# EAGLE schematic Cricket Game Schematic (EAGLE 9.6.2)
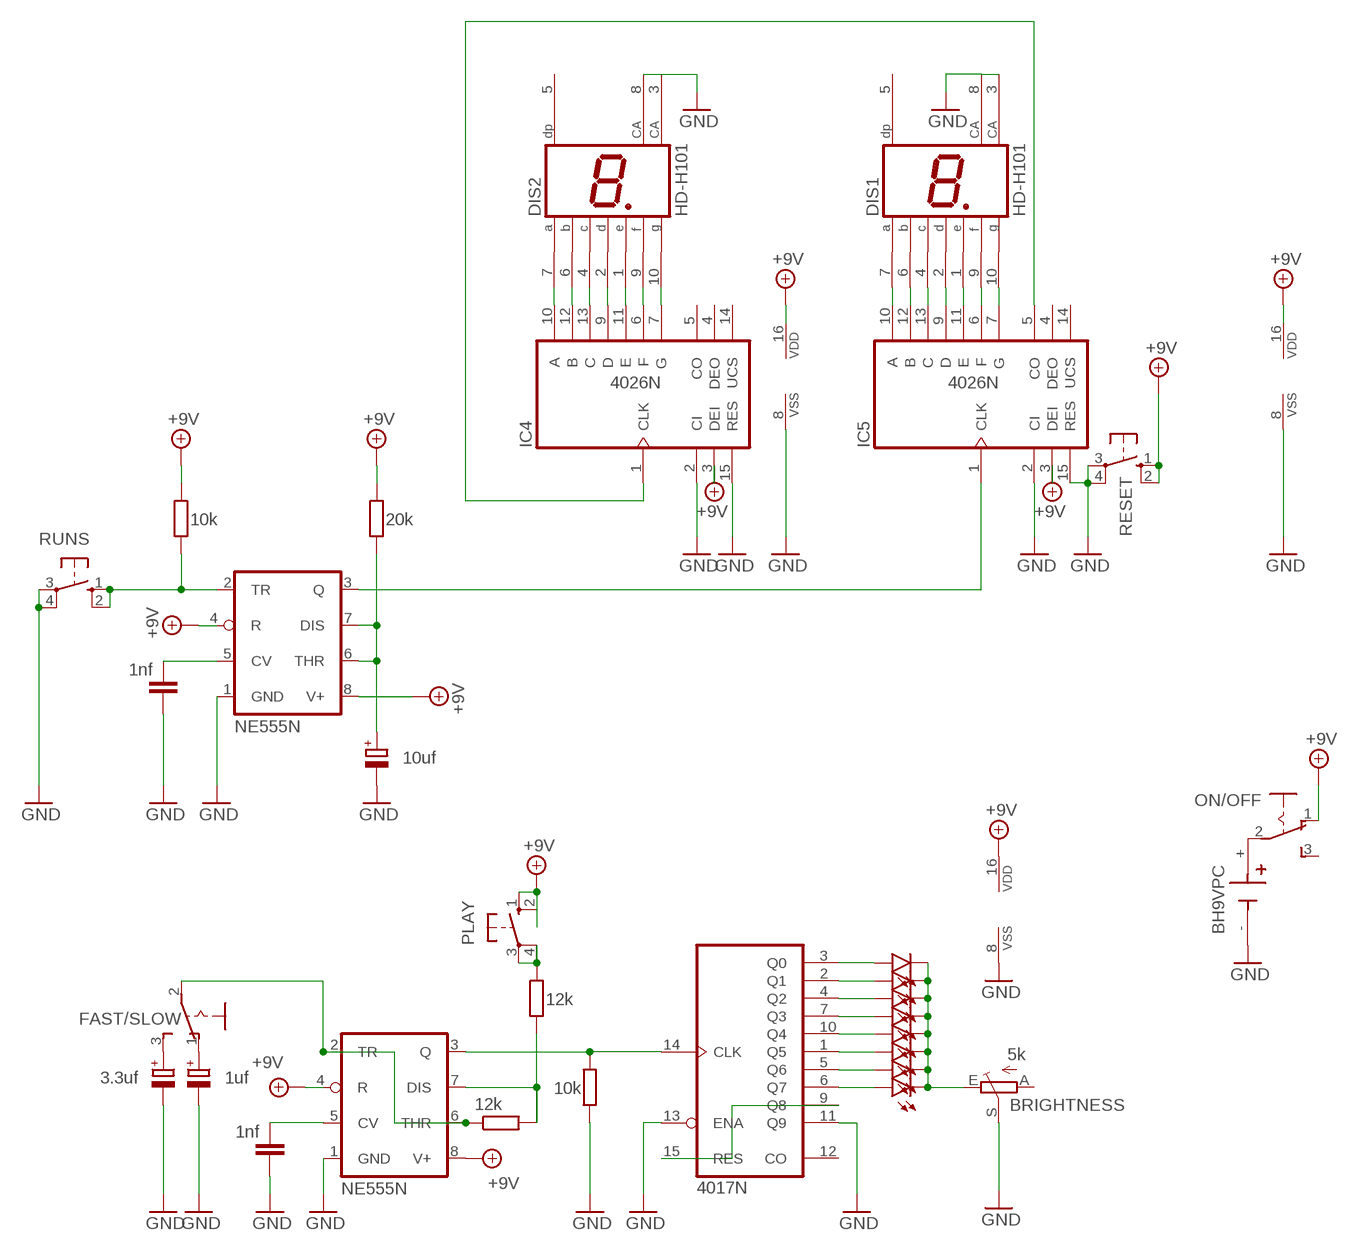
[diagram p0: schematic, sheet 1]

## Parts
BRIGHTNESS  5k  TRIM_EU-B25P  [B25P]
BT1  BH9VPC  [BAT_BH9VPC]
C1  1uf  CPOL-EUE2,5-6E  [E2,5-6E]
C2  3.3uf  CPOL-EUE2,5-6E  [E2,5-6E]
C3  1nf  C-EU050-024X044  [C050-024X044]
C4  1nf  C-EU050-024X044  [C050-024X044]
C5  10uf  CPOL-EUE2,5-6E  [E2,5-6E]
DIS1  HD-H101  [HDSP-M]
DIS2  HD-H101  [HDSP-M]
FAST/SLOW  M251  [M251]
IC1  NE555N  [DIL08]
IC2  4017N  [DIL16]
IC3  NE555N  [DIL08]
IC4  4026N  [DIL16]
IC5  4026N  [DIL16]
LED1  LED3MM  [LED3MM]
LED2  LED3MM  [LED3MM]
LED3  LED3MM  [LED3MM]
LED4  LED3MM  [LED3MM]
LED5  LED3MM  [LED3MM]
LED6  LED3MM  [LED3MM]
LED7  LED3MM  [LED3MM]
LED8  LED3MM  [LED3MM]
ON/OFF  M251  [M251]
PLAY  10-XX  [B3F-10XX]
R1  12k  R-EU_0207/10  [0207/10]
R2  12k  R-EU_0207/10  [0207/10]
R3  20k  R-EU_0207/10  [0207/10]
R4  10k  R-EU_0207/10  [0207/10]
R5  10k  R-EU_0207/10  [0207/10]
RESET  10-XX  [B3F-10XX]
RUNS  10-XX  [B3F-10XX]

## Nets
+9V: IC1.4(R) IC1.8(V+) IC2.16(VDD) IC3.4(R) IC3.8(V+) IC4.3(DEI) IC4.16(VDD) IC5.3(DEI) IC5.16(VDD) ON/OFF.1(O) PLAY.1(S) PLAY.2(S1) R3.1 R5.1 RESET.1(S) RESET.2(S1)
GND: BRIGHTNESS.S BT1.- C1.- C2.- C3.1 C4.1 C5.- DIS1.3(CA) DIS1.8(CA) DIS2.3(CA) DIS2.8(CA) IC1.1(GND) IC2.8(VSS) IC2.11(Q9) IC2.13(ENA) IC3.1(GND) IC4.2(CI) IC4.8(VSS) IC4.15(RES) IC5.2(CI) IC5.8(VSS) IC5.15(RES) R4.1 RESET.3(P) RESET.4(P1) RUNS.3(P) RUNS.4(P1)
N$1: FAST/SLOW.2(P) IC1.2(TR) IC1.6(THR) R1.1
N$2: C1.+ FAST/SLOW.1(O)
N$3: C2.+ FAST/SLOW.3(S)
N$4: IC1.7(DIS) R1.2 R2.2
N$5: IC1.3(Q) IC2.14(CLK) R4.2
N$6: PLAY.3(P) PLAY.4(P1) R2.1
N$7: IC2.9(Q8) IC2.15(RES)
N$8: IC2.3(Q0) LED1.A
N$9: BRIGHTNESS.E LED1.K(C) LED2.K(C) LED3.K(C) LED4.K(C) LED5.K(C) LED6.K(C) LED7.K(C) LED8.K(C)
N$10: IC2.2(Q1) LED2.A
N$11: IC2.4(Q2) LED3.A
N$12: IC2.7(Q3) LED4.A
N$13: IC2.10(Q4) LED5.A
N$14: IC2.1(Q5) LED6.A
N$15: IC2.5(Q6) LED7.A
N$16: IC2.6(Q7) LED8.A
N$17: DIS2.7(A) IC4.10(A)
N$18: DIS2.6(B) IC4.12(B)
N$19: DIS2.4(C) IC4.13(C)
N$20: DIS2.2(D) IC4.9(D)
N$21: DIS2.1(E) IC4.11(E)
N$22: DIS2.9(F) IC4.6(F)
N$23: DIS2.10(G) IC4.7(G)
N$24: DIS1.7(A) IC5.10(A)
N$25: DIS1.6(B) IC5.12(B)
N$26: DIS1.4(C) IC5.13(C)
N$27: DIS1.2(D) IC5.9(D)
N$28: DIS1.1(E) IC5.11(E)
N$29: DIS1.9(F) IC5.6(F)
N$30: DIS1.10(G) IC5.7(G)
N$31: IC3.3(Q) IC5.1(CLK)
N$32: IC3.2(TR) R5.2 RUNS.1(S) RUNS.2(S1)
N$33: C3.2 IC1.5(CV)
N$34: C4.2 IC3.5(CV)
N$35: IC4.1(CLK) IC5.5(CO)
N$36: C5.+ IC3.6(THR) IC3.7(DIS) R3.2
N$37: BT1.+ ON/OFF.2(P)
Unconnected: BRIGHTNESS.A DIS1.5(DP) DIS2.5(DP) IC2.12(CO) IC4.4(DEO) IC4.5(CO) IC4.14(UCS) IC5.4(DEO) IC5.14(UCS) ON/OFF.3(S)

## Library data of the parts
BRIGHTNESS = pot:TRIM_EU-: POTENTIOMETER
BT1 = BH9VPC:BH9VPC: 9V Battery Holder Check prices <https://pricing.snapeda.com/parts/BH9VPC/MPD%20%28Memory%20Protection%20Devices%29/view-part?ref=eda>; AVAILABILITY: Warning; DESCRIPTION: BATTERY HOLDER 9V PC PIN; MF: MPD (Memory Protection Devices); MP: BH9VPC; PACKAGE: None; PRICE: None; PURCHASE-URL: https://pricing.snapeda.com/search/part/BH9VPC/?ref=eda
C1 C2 C5 = rcl:CPOL-EU: POLARIZED CAPACITOR, European symbol; SPICEPREFIX: C
C3 C4 = rcl:C-EU: CAPACITOR, European symbol; SPICEPREFIX: C
DIS1 DIS2 = display-hp:HD-H101: LED DISPLAY 1-character 7 segment, decimal point right; OC_FARNELL: unknown; OC_NEWARK: unknown
FAST/SLOW ON/OFF = switches M Dunn:M251: SLIDING SWITCH Mors, distributor Buerklin, 11G702
IC1 IC3 = linear:*555: TIMER
IC2 = 40xx:4017: COUNTER/DIVIDER
IC4 IC5 = 40xx:4026: Decade COUNTER/DIVIDER, 7-seg. outputs
LED1-LED8 = led:LED: LED OSRAM: - CHIPLED LG R971, LG N971, LY N971, LG Q971, LY Q971, LO R971, LY R971 LH N974, LH R974 LS Q976, LO Q976, LY Q976 LO Q996 - Hyper CHIPLED LW Q18S LB Q993, LB Q99A, LB R99A - SideLED LS A670, LO A670, LY A670, LG A670, LP A670 LB A673, LV A673, LT A673, LW A673 LH A674 LY A675 LS A676, LA A676, LO A676, LY A676, LW A676 LS A679, LY A679, LG A679 - Hyper Micro SIDELED® LS Y876, LA Y876, LO Y876, LY Y876 LT Y87S - SmartLED LW L88C, LW L88S LB L89C, LB L89S, LG L890 LS L89K, LO L89K, LY L89K LS L896, LA L896, LO L896, LY L896 - TOPLED LS T670, LO T670, LY T670, LG T670, LP T670 LSG T670, LSP T670, LSY T670, LOP T670, LYG T670 LG T671, LOG T671, LSG T671 LB T673, LV T673, LT T673, LW T673 LH T674 LS T676, LA T676, LO T676, LY T676, LB T676, LH T676, LSB T676, LW T676 LB T67C, LV T67C, LT T67C, LS T67K, LO T67K, LY T67K, LW E67C LS E67B, LA E67B, LO E67B, LY E67B, LB E67C, LV E67C, LT E67C LW T67C LS T679, LY T679, LG T679 LS T770, LO T770, LY T770, LG T770, LP T770 LB T773, LV T773, LT T773, LW T773 LH T774 LS E675, LA E675, LY E675, LS T675 LS T776, LA T776, LO T776, LY T776, LB T776 LHGB T686 LT T68C, LB T68C - Hyper Mini TOPLED® LB M676 - Mini TOPLED Santana® LG M470 LS M47K, LO M47K, LY M47K Source: http://www.osram.convergy.de LUXEON: - LUMILED® LXK2-PW12-R00, LXK2-PW12-S00, LXK2-PW14-U00, LXK2-PW14-V00 LXK2-PM12-R00, LXK2-PM12-S00, LXK2-PM14-U00 LXK2-PE12-Q00, LXK2-PE12-R00, LXK2-PE12-S00, LXK2-PE14-T00, LXK2-PE14-U00 LXK2-PB12-K00, LXK2-PB12-L00, LXK2-PB12-M00, LXK2-PB14-N00, LXK2-PB14-P00, LXK2-PB14-Q00 LXK2-PR12-L00, LXK2-PR12-M00, LXK2-PR14-Q00, LXK2-PR14-R00 LXK2-PD12-Q00, LXK2-PD12-R00, LXK2-PD12-S00 LXK2-PH12-R00, LXK2-PH12-S00 LXK2-PL12-P00, LXK2-PL12-Q00, LXK2-PL12-R00 Source: www.luxeon.com KINGBRIGHT: KA-3528ASYC Source: www.kingbright.com
PLAY RESET RUNS = switch-omron:10-XX: OMRON SWITCH; MPN: B3F-1000; OC_FARNELL: 176432; OC_NEWARK: 36M3542
R1-R5 = rcl:R-EU_: RESISTOR, European symbol; SPICEPREFIX: R